# EasyEDA Pro project ProPrj_LoRa P_2026-10-21.epro

# Schematic Schematic1
Board Name: Board1; Create Date: 2026-07-01; Page Name: P1; Project Name: LoRa Puck; Schematic Name: Schematic1; Update Date: 2026-07-01; Company: EasyEDA.com; Page Size: A4; Version: V1.0
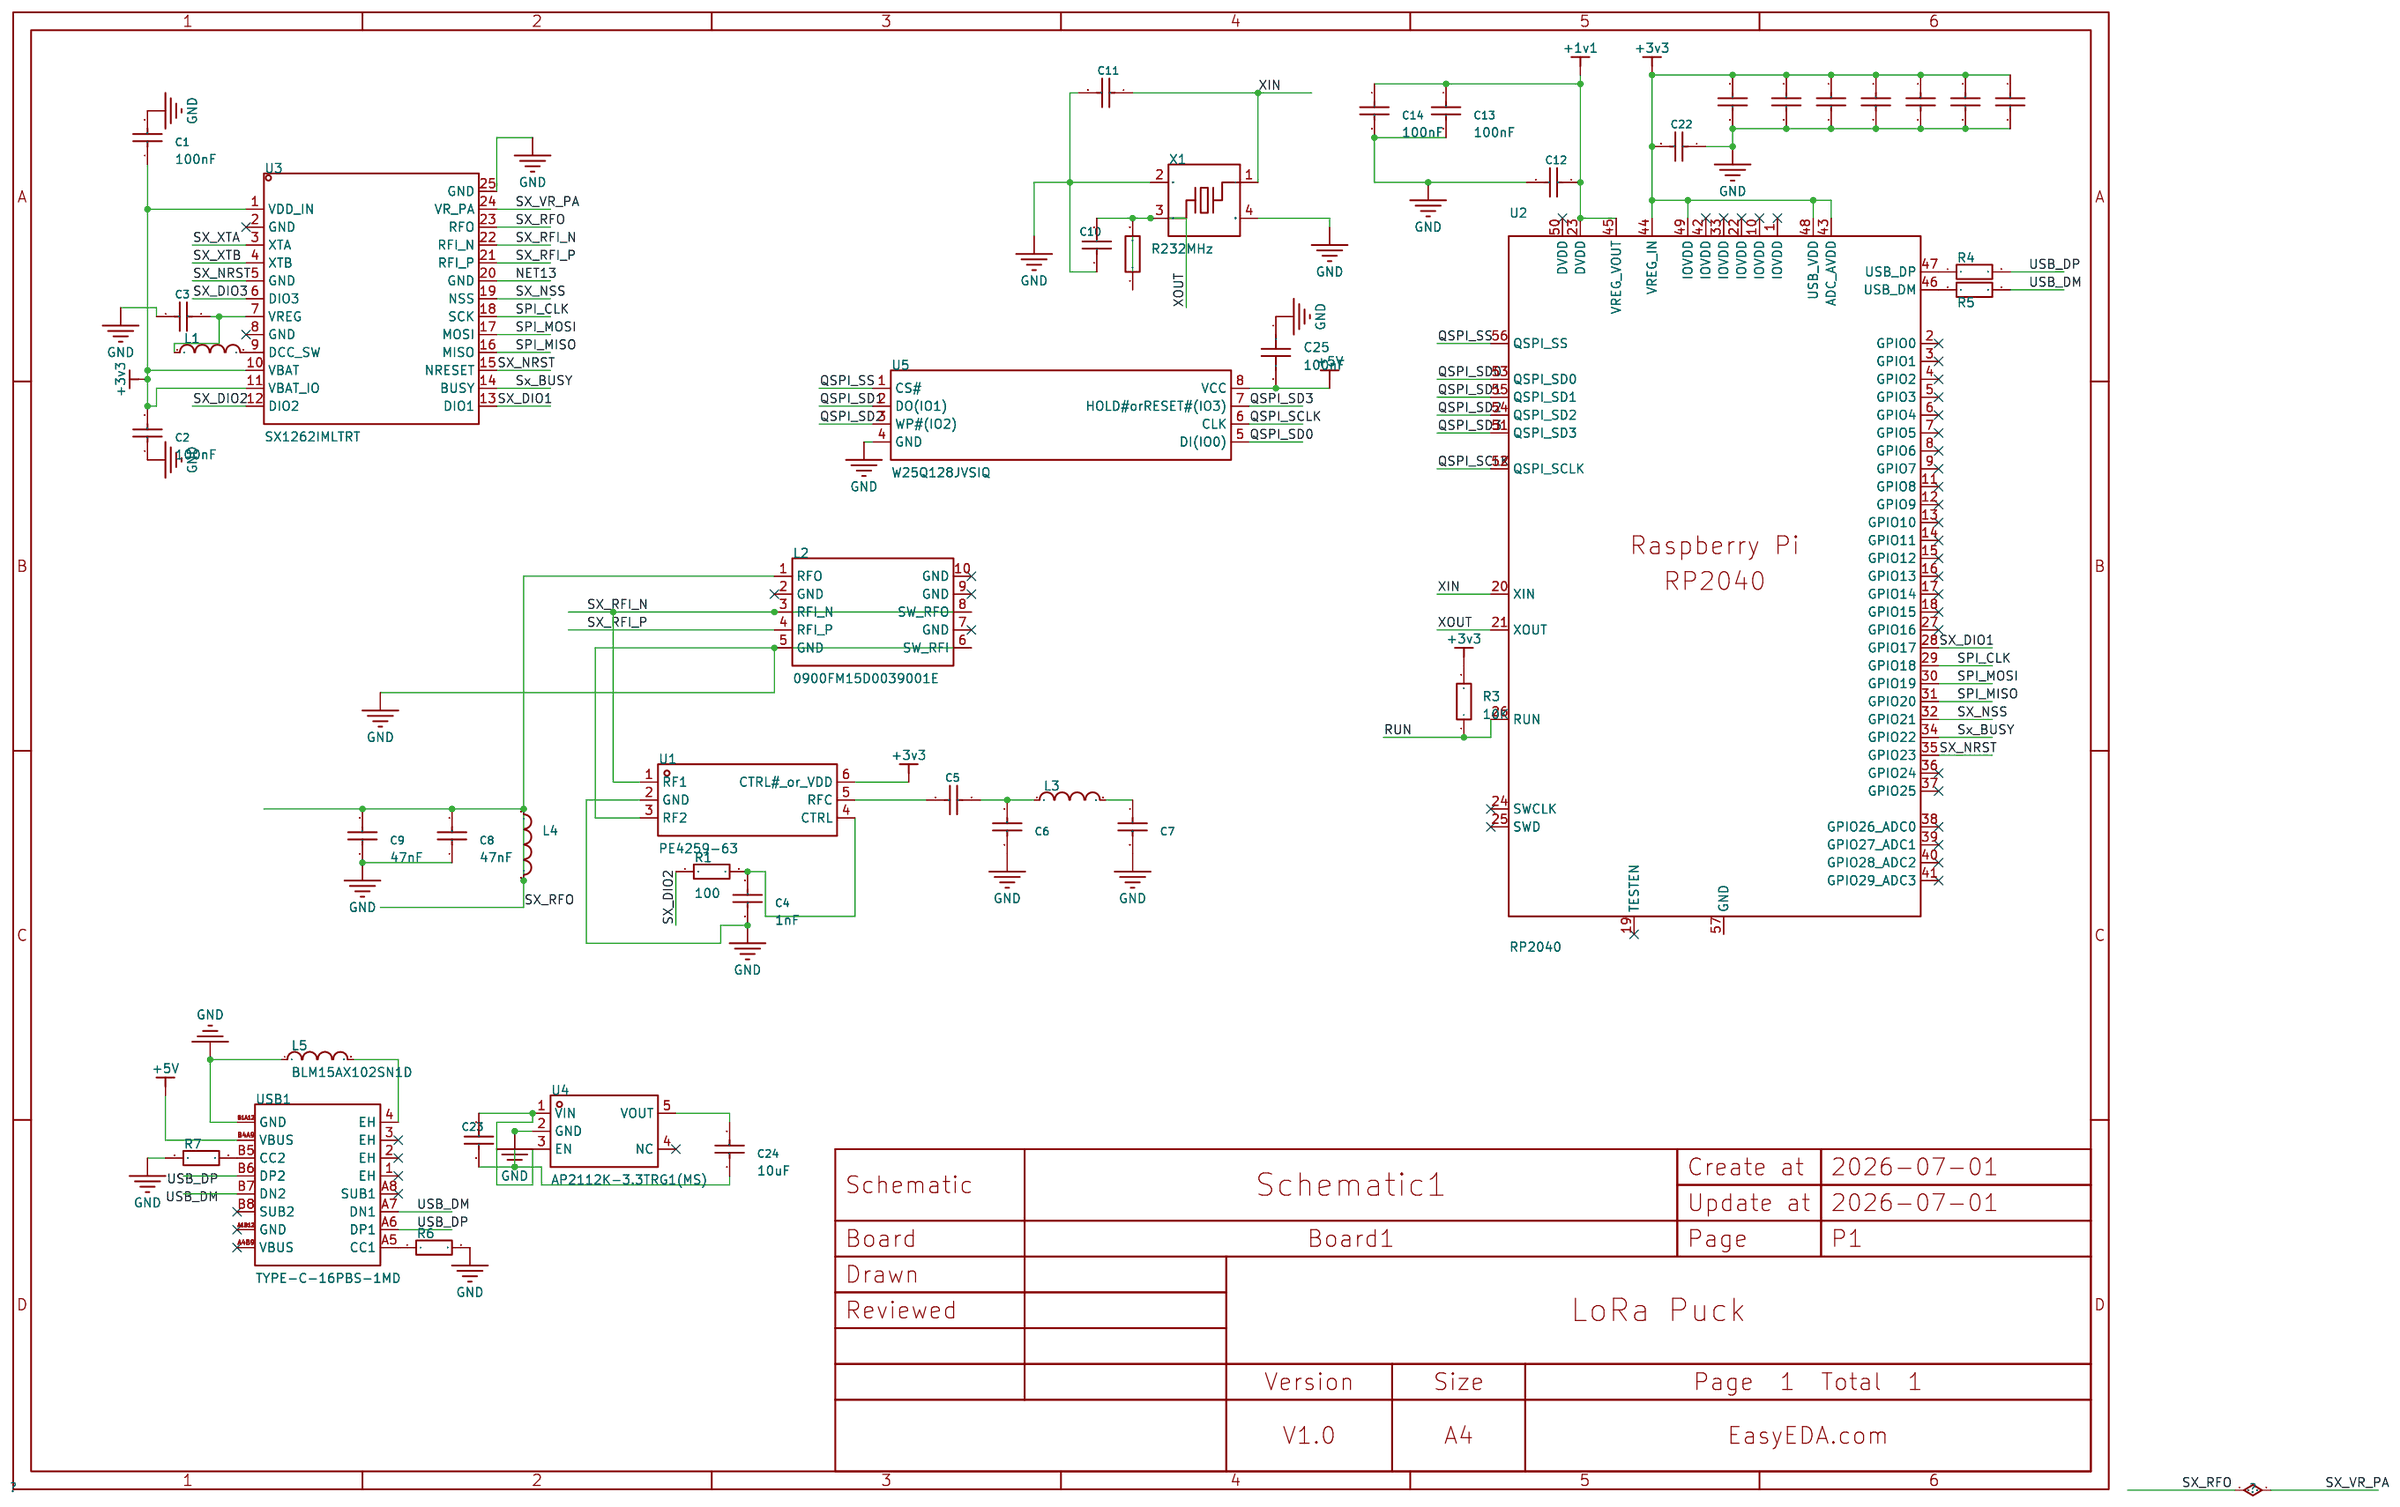
[diagram p0: schematic sheet]

## Parts
C1  100nF  [C0603]
C2  100nF  [C0603]
C3  470nF  [C0603]
C4  1nF  [C0603]
C5  39pF  [C0603]
C6  3.3pF  [C0603]
C7  3.3pF  [C0603]
C8  47nF  [C0603]
C9  47nF  [C0603]
C10  1nF  [C0603]
C11  1nF  [C0603]
C12  1uF  [C0603]
C13  100nF  [C0603]
C14  100nF  [C0603]
C15  100nF  [C0603]
C16  100nF  [C0603]
C17  100nF  [C0603]
C18  100nF  [C0603]
C19  100nF  [C0603]
C20  100nF  [C0603]
C21  100nF  [C0603]
C22  1uF  [C0603]
C23  10uF  [C0603]
C24  10uF  [C0603]
C25  100nF  [C0603]
L1  15uH  [L0603]
L2  0900FM15D0039001E  [FILTER-SMD_10P-L2.0-W1.3-BL]
L3  9.1nH  [L0603]
L4  47nH  [L0603]
L5  BLM15AX102SN1D  [L0402]
R1  100  [R0603]
R2  1K  [R0603]
R3  10K  [R0603]
R4  27.4  [R0603]
R5  22.7  [R0603]
R6  5.1K  [R0603]
R7  5.1K  [R0603]
U1  PE4259-63  [SC-70-6_L2.2-W1.3-P0.65-LS2.1-BL]
U2  RP2040  [QFN-56_L7.0-W7.0-P0.40-TL-EP4.0]
U3  SX1262IMLTRT  [QFN-24_L4.0-W4.0-P0.50-BL-EP2.6]
U4  AP2112K-3.3TRG1(MS)  [SOT-23-5_L2.9-W1.6-P0.95-LS2.7-BR]
U5  W25Q128JVSIQ  [SOIC-8_L5.3-W5.3-P1.27-LS8.0-BL]
USB1  TYPE-C-16PBS-1MD  [TYPE-C-SMD_TYPE-C-16PBS-1MD]
X1  32MHz  [CRYSTAL-SMD_4P-L3.2-W2.5-BL]

## Library data of the parts
C1-C24 = CC0603KRX7R8BB104: Capacitance: Tolerance:±10% Tolerance:±10% Voltage Rated: Temperature Coefficient:; LCSC Part Name: 100nF ±10% 25V; Supplier Part: C92490; Manufacturer: YAGEO(国巨); Supplier Footprint: 0603; JLCPCB Part Class: Extended Part; Datasheet: https://atta.szlcsc.com/upload/public/pdf/source/20170211/1486785656773.pdf; Supplier: LCSC; Tolerance: ±10%
C25 = CAP_0603: Supplier Footprint: 0603
L1 L3 L4 = L_0603
L2 = 0900FM15D0039001E: Frequency - Center:866MHz；915Hz Impedance:50Ω; Supplier Part: C17557877; Manufacturer: JOHANSON(约翰逊); Supplier Footprint: SMD-10P,2x1.2mm; JLCPCB Part Class: Extended Part; Datasheet: https://item.szlcsc.com/datasheet/0900FM15D0039001E/18687100.html; Supplier: LCSC; Frequency - Center: 866MHz；915Hz; Impedance: 50Ω
L5 = BLM15AX102SN1D: Impedance @ Frequency:1kΩ@100MHz Tolerance:±25% Tolerance:±25% DC Resistance(DCR):490mΩ Current Rating:350mA Number of Circuits:1 Operating Temperature:-55℃~+125℃ Operating Temperature:-55℃~+125℃; LCSC Part Name: 1 1kΩ@100MHz; Supplier Part: C85815; Manufacturer: muRata(村田); Supplier Footprint: 0402; JLCPCB Part Class: Extended Part; Datasheet: https://item.szlcsc.com/datasheet/BLM15AX102SN1D/86991.html; Supplier: LCSC; Impedance @ Frequency: 1kΩ@100MHz; Tolerance: ±25%; DC Resistance(DCR): 490mΩ; Current Rating: 350mA; Number of Circuits: 1; Operating Temperature: -55℃~+125℃
R1-R7 = Res_0603: Supplier Footprint: 0603
U1 = PE4259-63: Frequency range:- Frequency range:- isolation:30dB Insertion loss:0.35dB Voltage - Supply:1.8V~3.3V Voltage - Supply:1.8V~3.3V operating temperature:-40℃~+85℃ operating temperature:-40℃~+85℃; LCSC Part Name: 10MHz-3.0GHzSPDT高功率UltraCMOS射频开关; Supplier Part: C470892; Manufacturer: pSemi(游隼半导体); Supplier Footprint: SC-70-6; JLCPCB Part Class: Extended Part; Datasheet: https://item.szlcsc.com/datasheet/PE4259-63/477154.html; Supplier: LCSC; isolation: 30dB; Insertion loss: 0.35dB; Voltage - Supply: 1.8V~3.3V; operating temperature: -40℃~+85℃
U2 = RP2040: LCSC Part Name: 微控制器; Supplier Part: C2961140; Manufacturer: Raspberry Pi(树莓派); Supplier Footprint: QFN-56-EP(7x7); JLCPCB Part Class: Extended Part; Datasheet: https://item.szlcsc.com/datasheet/RP2040/3349129.html; Supplier: LCSC
U3 = SX1262IMLTRT: Frequency Range:- Frequency Range:- Interface:SPI Voltage - Supply:1.8V~3.7V Voltage - Supply:1.8V~3.7V Applications:General-purposeISM Output Power:22dBm Data Rate:300Kbps Current Of Transmitting:32mA Sensitivity:-148dBm Receive Current:4.2mA Operating T; Supplier Part: C191341; Manufacturer: SEMTECH; Supplier Footprint: QFN-24-EP(4x4); JLCPCB Part Class: Extended Part; Datasheet: https://item.szlcsc.com/datasheet/SX1262IMLTRT/216566.html; Supplier: LCSC; Interface: SPI; Voltage - Supply: 1.8V~3.7V; Applications: General-purposeISM; Output Power: 22dBm; Data Rate: 300Kbps; Current Of Transmitting: 32mA; Sensitivity: -148dBm; Receive Current: 4.2mA; Operating Temperature: -40℃~+85℃
U4 = AP2112K-3.3TRG1(MS): Output Configuration:Positive Voltage - Supply:6V Output Voltage:3.3V Output Voltage:3.3V Output Current:600mA Power Supply Rejection Ratio (PSRR):75dB@(1kHz) Voltage Dropout:320mV@(600mA) standby current:2uA Noise:- Features:Enable control；Short Circuit; LCSC Part Name: 3.3V 600mA 6V; Supplier Part: C22365427; Manufacturer: MSKSEMI(美森科); Supplier Footprint: SOT-23-5; JLCPCB Part Class: Extended Part; Datasheet: https://item.szlcsc.com/datasheet/AP2112K-3.3TRG1(MS)/23832169.html; Supplier: LCSC; Output Configuration: Positive; Voltage - Supply: 6V; Output Voltage: 3.3V; Output Current: 600mA; Power Supply Rejection Ratio (PSRR): 75dB@(1kHz); Voltage Dropout: 320mV@(600mA); standby current: 2uA; Features: Enable control；Short Circuit Protection；Over Current Protection；Thermal shutdown; Operating Temperature: -40℃~+125℃@(Tj); Output Type: Fixed; Number of Outputs: 1
U5 = W25Q128JVSIQ_C113767: Interface:SPI Memory Size:- Clock Frequency:133MHz Voltage - Supply:2.7V~3.6V Voltage - Supply:2.7V~3.6V Program / Erase Cycles:100,000 Cycles Page Programming Time (Tpp):3ms Operating Temperature:- Operating Temperature:-; LCSC Part Name: 支持双路/四路SPI接口的3V、128Mbit 串行闪存; Supplier Part: C113767; Manufacturer: Winbond(华邦); Supplier Footprint: SOIC-8-208mil; JLCPCB Part Class: Extended Part; Datasheet: https://item.szlcsc.com/datasheet/W25Q128JVSIQ/115003.html; Supplier: LCSC; Interface: SPI; Clock Frequency: 133MHz; Voltage - Supply: 2.7V~3.6V; Program / Erase Cycles: 100,000 Cycles; Page Programming Time (Tpp): 3ms
USB1 = TYPE-C-16PBS-1MD: Connector Type:Type-C Gender:Female Mounting Type:Surface Mount, Right Angle Number of Ports:1 Current Rating-Power:3A Voltage Rating:5V Connect-Disconnect Life:5000 cycles Length:7.35mm Operating Temperature:-25℃~+85℃ Operating Temperature:-25℃~+85℃; LCSC Part Name: Type-C 母 卧贴; Supplier Part: C51927421; Manufacturer: CAX(创都); Supplier Footprint: SMD; JLCPCB Part Class: Extended Part; Datasheet: https://item.szlcsc.com/datasheet/TYPE-C-16PBS-1MD/54633782.html; Supplier: LCSC; Connector Type: Type-C; Gender: Female; Mounting Type: Surface Mount, Right Angle; Number of Ports: 1; Current Rating-Power: 3A; Voltage Rating: 5V; Connect-Disconnect Life: 5000 cycles; Length: 7.35mm; Operating Temperature: -25℃~+85℃
X1 = NX3225SA-32.000M-STD-CSR-1: Frequency:32MHz Normal temperature Frequency Tolerance:±15ppm Normal temperature Frequency Tolerance:±15ppm Load Capacitance:8pF Frequency Stability:±15ppm Frequency Stability:±15ppm Equivalent Series Resistance(ESR):50Ω Operating Temperature:-10℃~+75℃ Op; LCSC Part Name: 32MHz ±15ppm 8pF; Supplier Part: C1985986; Manufacturer: NDK; Supplier Footprint: SMD3225-4P; JLCPCB Part Class: Extended Part; Datasheet: https://item.szlcsc.com/datasheet/NX3225SA-32.000M-STD-CSR-1/2077530.html; Supplier: LCSC; Normal temperature Frequency Tolerance: ±15ppm; Load Capacitance: 8pF; Frequency Stability: ±15ppm; Equivalent Series Resistance(ESR): 50Ω; Operating Temperature: -10℃~+75℃

## Nets
+1v1: C12.1 C13.1 C14.1 U2.23(DVDD) U2.45(VREG_VOUT)
+3v3: C1.1 C2.2 C15.1 C16.1 C17.1 C18.1 C19.1 C20.1 C21.1 C22.2 R3.2 U1.6(CTRL# or VDD) U2.43(ADC_AVDD) U2.44(VREG_IN) U2.48(USB_VDD) U2.49(IOVDD) U3.1(VDD_IN) U3.10(VBAT) U3.11(VBAT_IO)
+5V: C25.2 U5.8(VCC) USB1.B4A9(VBUS)
GND: C1.2 C2.1 C3.2 C4.1 C6.2 C7.2 C8.1 C9.1 C10.1 C11.2 C12.2 C13.2 C14.2 C15.2 C16.2 C17.2 C18.2 C19.2 C20.2 C21.2 C22.1 C23.1 C24.1 C25.1 L2.5(GND) L2.6(SW_RFI) L5.1 R6.2 R7.1 U1.2(GND) U1.3(RF2) U3.25(GND) U4.2(GND) U5.4(GND) USB1.B1A12(GND) X1.2(GND) X1.4(GND)
NET13: U3.20(GND)
QSPI_SCLK: U2.52(QSPI_SCLK) U5.6(CLK)
QSPI_SD0: U2.53(QSPI_SD0) U5.5(DI(IO0))
QSPI_SD1: U2.55(QSPI_SD1) U5.2(DO(IO1))
QSPI_SD2: U2.54(QSPI_SD2) U5.3(WP#(IO2))
QSPI_SD3: U2.51(QSPI_SD3) U5.7(HOLD#orRESET#(IO3))
QSPI_SS: U2.56(QSPI_SS) U5.1(CS#)
RUN: R3.1 U2.26(RUN)
SPI_CLK: U2.29(GPIO18) U3.18(SCK)
SPI_MISO: U2.31(GPIO20) U3.16(MISO)
SPI_MOSI: U2.30(GPIO19) U3.17(MOSI)
Sx_BUSY: U2.34(GPIO22) U3.14(BUSY)
SX_DIO1: U2.28(GPIO17) U3.13(DIO1)
SX_DIO2: R1.1 U3.12(DIO2)
SX_DIO3: U3.6(DIO3)
SX_NRST: U2.35(GPIO23) U3.5(GND) U3.15(NRESET)
SX_NSS: U2.32(GPIO21) U3.19(NSS)
SX_RFI_N: L2.3(RFI_N) L2.8(SW_RFO) U1.1(RF1) U3.22(RFI_N)
SX_RFI_P: L2.4(RFI_P) U3.21(RFI_P)
SX_RFO: C8.2 C9.2 L2.1(RFO) L4.1 L4.2 U3.23(RFO) U3.24(VR_PA)
SX_XTA: U3.3(XTA)
SX_XTB: U3.4(XTB)
USB_DM: R5.2 USB1.A7(DN1) USB1.B7(DN2)
USB_DP: R4.2 USB1.A6(DP1) USB1.B6(DP2)
XIN: C11.1 U2.20(XIN) X1.1
XOUT: C10.2 R2.1 R2.2 U2.21(XOUT) X1.3
$1N27: L1.2 U3.9(DCC_SW)
$1N28: C3.1 L1.1 U3.7(VREG)
$1N54: C4.2 R1.2 U1.4(CTRL)
$1N61: C5.2 U1.5(RFC)
$1N69: C5.1 C6.1 L3.1
$1N70: C7.1 L3.2
$1N85: R4.1 U2.47(USB_DP)
$1N86: R5.1 U2.46(USB_DM)
$1N98: C23.2 U4.1(VIN) U4.3(EN)
$1N100: C24.2 U4.5(VOUT)
$1N103: L5.2 USB1.4(EH)
$1N111: R6.1 USB1.A5(CC1)
$1N112: R7.2 USB1.B5(CC2)

Not connected (* = marked no-connect by the designer): L2 2(GND)* 7(GND)* 9(GND)* 10(GND)*; U2 1(IOVDD)* 2(GPIO0)* 3(GPIO1)* 4(GPIO2)* 5(GPIO3)* 6(GPIO4)* 7(GPIO5)* 8(GPIO6)* 9(GPIO7)* 10(IOVDD)* 11(GPIO8)* 12(GPIO9)* 13(GPIO10)* 14(GPIO11)* 15(GPIO12)* 16(GPIO13)* 17(GPIO14)* 18(GPIO15)* 19(TESTEN)* 22(IOVDD)* 24(SWCLK)* 25(SWD)* 27(GPIO16)* 33(IOVDD)* 36(GPIO24)* 37(GPIO25)* 38(GPIO26_ADC0)* 39(GPIO27_ADC1)* 40(GPIO28_ADC2)* 41(GPIO29_ADC3)* 42(IOVDD)* 50(DVDD)* 57(GND); U3 2(GND)* 8(GND)*; U4 4(NC)*; USB1 1(EH)* 2(EH)* 3(EH)* A1B12(GND)* A4B9(VBUS)* A8(SUB1)* B8(SUB2)*

# Board PCB1
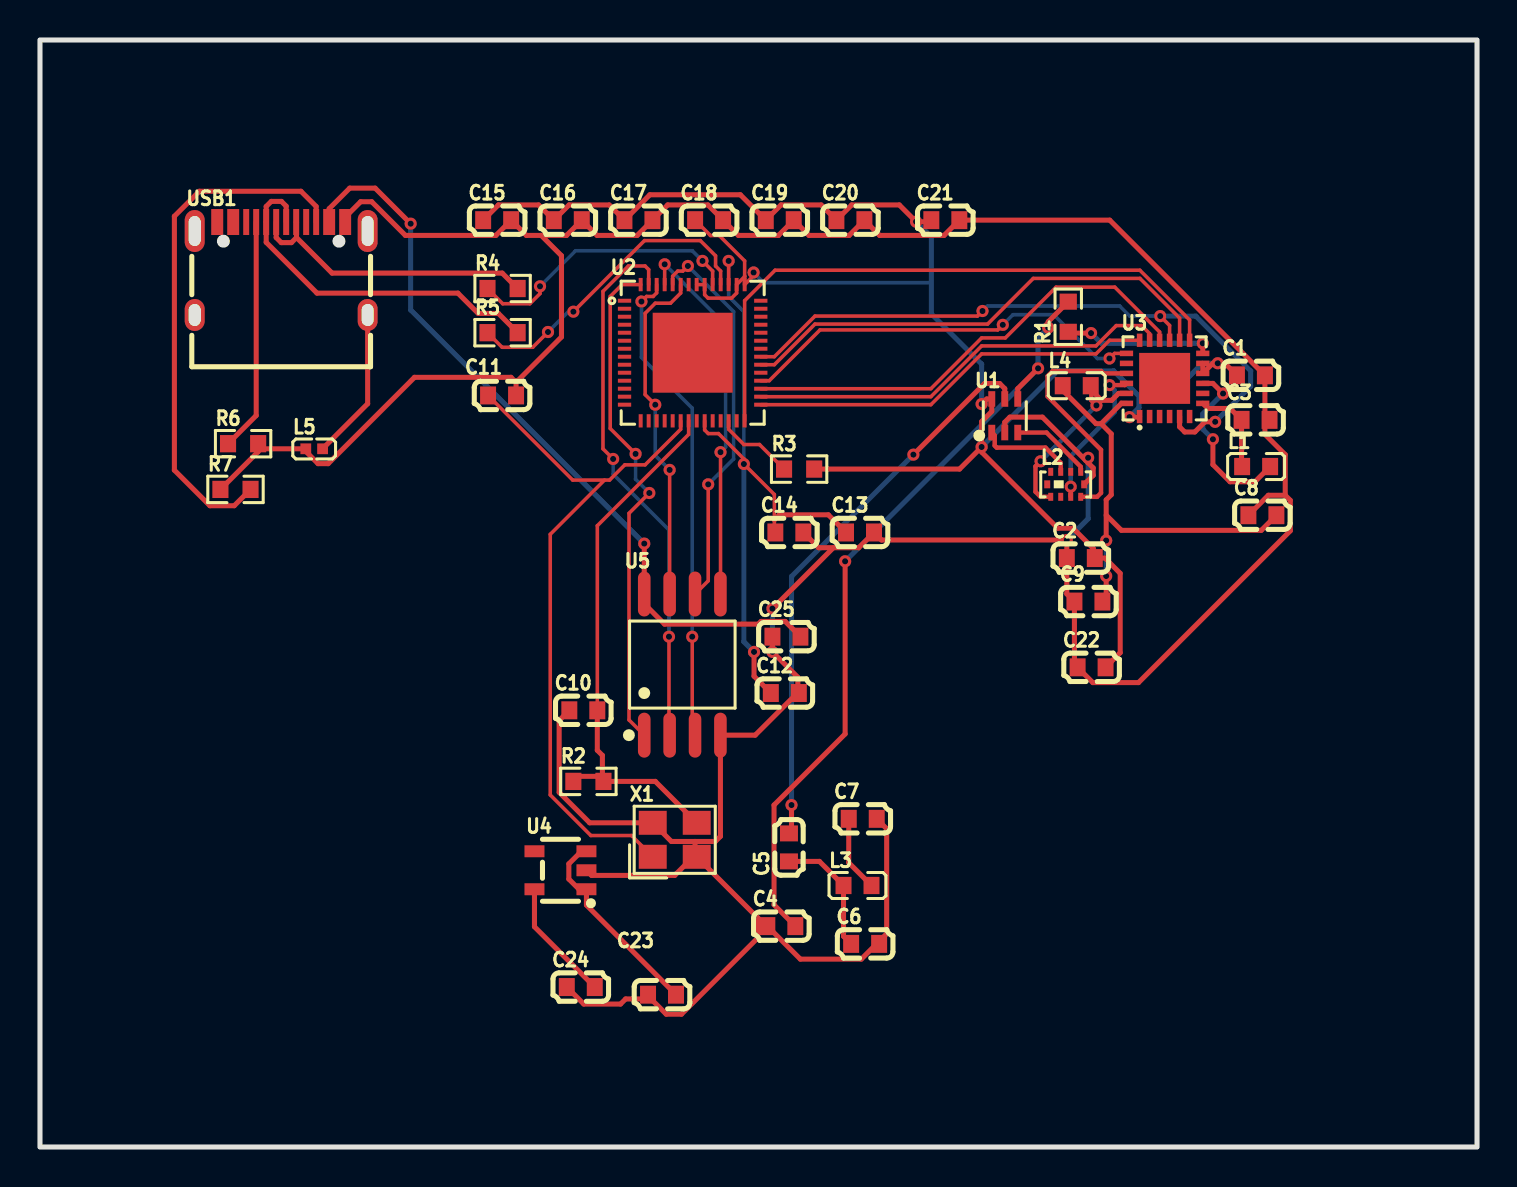
[diagram p1: board, top side]
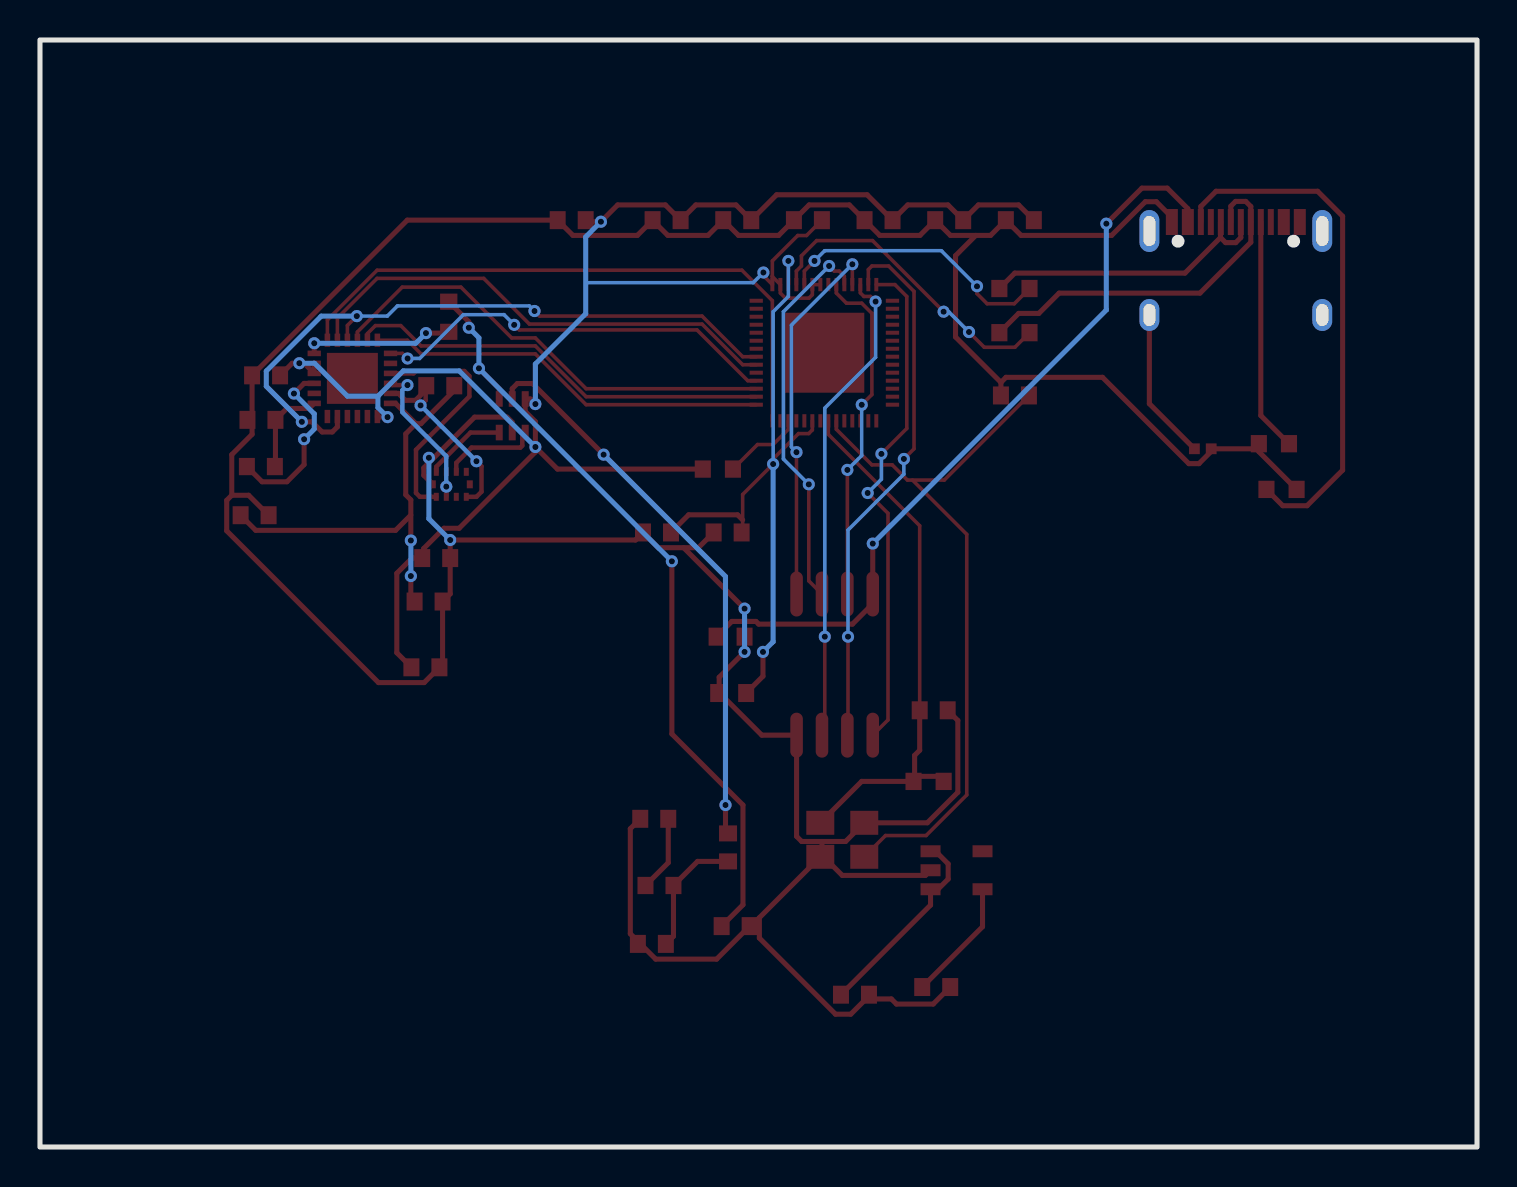
[diagram p2: board, bottom side, seen from below]

Outline 71.88 x 55.37 mm; copper layers: Top Layer, Bottom Layer. Coordinates in mm from the lower left corner of the outline.
Outline path: rectangle 0,55.37 71.88,0
Stack: Top Layer 0.035mm / Dielectric1 1.51mm FR4 er 4.5 / Bottom Layer 0.035mm

## Design rules (mm)
spacing copperThickness1oz (default): track to track 0.102, other pairs 0.152 to 0.3
spacing copperThickness2oz: track to track 0.203, other pairs 0.152 to 0.3
track width copperThickness1oz (default): min 0.127, default 0.254, max 2.54
track width copperThickness2oz: min 0.203, default 0.254, max 2.54
differential pair differentialPair (default): width min 0.127, default 0.254, max 2.54; gap min 0.152, default 0.152

## Placement (name value [footprint] x y rotation side)
C1  100nF  [C0603]  60.57 38.6 0 top
C2  100nF  [C0603]  52.06 29.46 0 top
C3  470nF  [C0603]  60.8 36.37 0 top
C4  1nF  [C0603]  37.08 11.05 0 top
C5  39pF  [C0603]  37.47 14.99 90 top
C6  3.3pF  [C0603]  41.28 10.16 0 top
C7  3.3pF  [C0603]  41.16 16.42 0 top
C8  47nF  [C0603]  61.15 31.6 0 top
C9  47nF  [C0603]  52.44 27.28 0 top
C10  1nF  [C0603]  27.18 21.84 0 top
C11  1nF  [C0603]  23.11 37.59 0 top
C12  1uF  [C0603]  37.26 22.71 0 top
C13  100nF  [C0603]  41.02 30.74 0 top
C14  100nF  [C0603]  37.48 30.74 0 top
C15  100nF  [C0603]  22.87 46.36 0 top
C16  100nF  [C0603]  26.4 46.36 0 top
C17  100nF  [C0603]  29.94 46.36 0 top
C18  100nF  [C0603]  33.47 46.36 0 top
C19  100nF  [C0603]  37 46.36 0 top
C20  100nF  [C0603]  40.54 46.36 0 top
C21  100nF  [C0603]  45.29 46.36 0 top
C22  1uF  [C0603]  52.6 23.99 0 top
C23  10uF  [C0603]  31.12 7.62 0 top
C24  10uF  [C0603]  27.05 8 0 top
C25  100nF  [C0603]  37.34 25.53 0 top
L1  15uH  [L0603]  60.83 34.04 0 top
L2  0900FM15D0039001E  [FILTER-SMD_10P-L2.0-W1.3-BL]  51.31 33.15 0 top
L3  9.1nH  [L0603]  40.89 13.08 0 top
L4  47nH  [L0603]  51.86 38.08 0 top
L5  BLM15AX102SN1D  [L0402]  13.72 34.92 0 top
R1  100  [R0603]  51.44 41.53 90 top
R2  1K  [R0603]  27.43 18.29 0 top
R3  10K  [R0603]  37.97 33.91 0 top
R4  27.4  [R0603]  23.14 42.94 0 top
R5  22.7  [R0603]  23.14 40.73 0 top
R6  5.1K  [R0603]  10.16 35.18 0 top
R7  5.1K  [R0603]  9.78 32.89 0 top
U1  PE4259-63  [SC-70-6_L2.2-W1.3-P0.65-LS2.1-BL]  48.26 36.58 0 top
U2  RP2040  [QFN-56_L7.0-W7.0-P0.40-TL-EP4.0]  32.65 39.73 0 top
U3  SX1262IMLTRT  [QFN-24_L4.0-W4.0-P0.50-BL-EP2.6]  56.26 38.45 0 top
U4  AP2112K-3.3TRG1(MS)  [SOT-23-5_L2.9-W1.6-P0.95-LS2.7-BR]  26.03 13.84 0 top
U5  W25Q128JVSIQ  [SOIC-8_L5.3-W5.3-P1.27-LS8.0-BL]  32.13 24.13 0 top
USB1  TYPE-C-16PBS-1MD  [TYPE-C-SMD_TYPE-C-16PBS-1MD]  12.06 43.94 0 top
X1  32MHz  [CRYSTAL-SMD_4P-L3.2-W2.5-BL]  31.75 15.37 0 top

## Footprints (pads in the part's own frame, mm; a bottom-side part is the same pattern mirrored in y, then rotated)
C0603
  rect 0.8x0.9 smd: 1(-0.7,0) 2(0.7,0)
CRYSTAL-SMD_4P-L3.2-W2.5-BL
  rect 1.4x1.2 smd: 1(-1.1,-0.85) 2(1.1,-0.85) 3(1.1,0.85) 4(-1.1,0.85)
FILTER-SMD_10P-L2.0-W1.3-BL
  rect 0.25x0.4 smd: 1(-0.75,-0.625) 2(-0.25,-0.625) 3(0.25,-0.625) 4(0.75,-0.625) 6(0.75,0.625) 7(0.25,0.625) 8(-0.25,0.625) 9(-0.75,0.625)
  rect 0.3x0.4 smd: 5(0.925,0) 10(-0.925,0)
L0402
  rect 0.54x0.54 smd: 1(-0.42,0) 2(0.42,0)
L0603
  rect 0.8x0.864 smd: 1(-0.7,0) 2(0.7,0)
QFN-24_L4.0-W4.0-P0.50-BL-EP2.6
  rect 0.28x0.665 smd: 1(-1.25,-1.907) 2(-0.75,-1.907) 3(-0.25,-1.907) 4(0.25,-1.907) 5(0.75,-1.907) 6(1.25,-1.907) 13(1.25,1.907) 14(0.75,1.907) 15(0.25,1.907) 16(-0.25,1.907) 17(-0.75,1.907) 18(-1.25,1.907)
  rect 0.665x0.28 smd: 7(1.907,-1.25) 8(1.907,-0.75) 9(1.907,-0.25) 10(1.907,0.25) 11(1.907,0.75) 12(1.907,1.25) 19(-1.907,1.25) 20(-1.907,0.75) 21(-1.907,0.25) 22(-1.907,-0.25) 23(-1.907,-0.75) 24(-1.907,-1.25)
  rect 2.55x2.55 smd: 25(0,0)
QFN-56_L7.0-W7.0-P0.40-TL-EP4.0
  rect 0.665x0.2 smd: 1(-3.408,2.6) 2(-3.408,2.2) 3(-3.408,1.8) 4(-3.408,1.4) 5(-3.408,1) 6(-3.408,0.6) 7(-3.408,0.2) 8(-3.408,-0.2) 9(-3.408,-0.6) 10(-3.408,-1) 11(-3.408,-1.4) 12(-3.408,-1.8) 13(-3.408,-2.2) 14(-3.408,-2.6) 29(3.408,-2.6) 30(3.408,-2.2) 31(3.408,-1.8) 32(3.408,-1.4) 33(3.408,-1) 34(3.408,-0.6) 35(3.408,-0.2) 36(3.408,0.2) 37(3.408,0.6) 38(3.408,1) 39(3.408,1.4) 40(3.408,1.8) 41(3.408,2.2) 42(3.408,2.6)
  rect 0.2x0.665 smd: 15(-2.6,-3.408) 16(-2.2,-3.408) 17(-1.8,-3.408) 18(-1.4,-3.408) 19(-1,-3.408) 20(-0.6,-3.408) 21(-0.2,-3.408) 22(0.2,-3.408) 23(0.6,-3.408) 24(1,-3.408) 25(1.4,-3.408) 26(1.8,-3.408) 27(2.2,-3.408) 28(2.6,-3.408) 43(2.6,3.408) 44(2.2,3.408) 45(1.8,3.408) 46(1.4,3.408) 47(1,3.408) 48(0.6,3.408) 49(0.2,3.408) 50(-0.2,3.408) 51(-0.6,3.408) 52(-1,3.408) 53(-1.4,3.408) 54(-1.8,3.408) 55(-2.2,3.408) 56(-2.6,3.408)
  rect 4x4 smd: 57(0,0)
R0603
  rect 0.806x0.864 smd: 1(-0.753,0) 2(0.753,0)
SC-70-6_L2.2-W1.3-P0.65-LS2.1-BL
  rect 0.35x0.78 smd: 1(-0.65,-0.84) 2(0,-0.84) 3(0.65,-0.84) 4(0.65,0.84) 5(0,0.84) 6(-0.65,0.84)
SOIC-8_L5.3-W5.3-P1.27-LS8.0-BL
  oval 0.63x2.25 smd: 1(-1.905,-3.53) 2(-0.635,-3.53) 3(0.635,-3.53) 4(1.905,-3.53) 5(1.905,3.53) 6(0.635,3.53) 7(-0.635,3.53) 8(-1.905,3.53)
SOT-23-5_L2.9-W1.6-P0.95-LS2.7-BR
  rect 1x0.6 smd: 1(1.3,-0.95) 2(1.3,0) 3(1.3,0.95) 4(-1.3,0.95) 5(-1.3,-0.95)
TYPE-C-SMD_TYPE-C-16PBS-1MD
  oval 1x2.1 hole 0.6x1.5: 1(-4.325,1.875) 2(4.325,1.875)
  oval 1x1.6 hole 0.6x1.1: 3(-4.325,-2.325) 4(4.325,-2.325)
  rect 0.6x1.3 smd: A1B12(-3.2,2.325) A4B9(-2.4,2.325) B1A12(3.2,2.325) B4A9(2.4,2.325)
  rect 0.3x1.3 smd: A5(-1.25,2.325) A6(-0.25,2.325) A7(0.25,2.325) A8(1.25,2.325) B5(1.75,2.325) B6(0.75,2.325) B7(-0.75,2.325) B8(-1.75,2.325)

## Nets
As in the schematic, except:
GND: C1.2 C2.1 C3.2 C4.1 C6.2 C7.2 C8.1 C9.1 C10.1 C11.2 C12.2 C13.2 C14.2 C15.2 C16.2 C17.2 C18.2 C19.2 C20.2 C21.2 C22.1 C23.1 C24.1 C25.1 L2.5 L5.1 R6.2 R7.1 U1.2 U3.25 U4.2 U5.4 USB1.B1A12 X1.2 X1.4
SX_RFI_N: L2.3 U3.22
SX_RFO: L2.1 L4.2 U3.23
SX_VR_PA: C8.2 C9.2 L4.1 U3.24
$1N58: L2.8 U1.1
$1N59: L2.6 U1.3

Pads without a net: L2 2 7 9 10; U2 1 2 3 4 5 6 7 8 9 10 11 12 13 14 15 16 17 18 19 22 24 25 27 33 36 37 38 39 40 41 42 50 57; U3 2 8; U4 4; USB1 1 2 3 A1B12 A4B9 A8 B8

## Via types
v1: diameter 0.61, hole 0.305, Top Layer to Bottom Layer, 51 vias

## Routing (per net, layer and track width the routed paths; a pad name or vN(x,y) marks a point on that pad's centre or on a via; arc(x,y) is an arc through that point)
+1V1: length 35.1
  Top Layer w0.18: 34.45,43.14 v1(34.45,44.32) ; 33.25,36.32 33.25,35.87 33.43,35.69 33.94,35.69 35.21,34.42 v1(35.21,34.16) 36.73,32.64 36.73,30.79 36.78,30.74
  Top Layer w0.254: v1(35.72,24.76) 35.72,23.55 36.56,22.71 ; 36.73,31.37 36.99,31.62 39.44,31.62 40.32,30.74
  Bottom Layer w0.18: v1(34.45,44.32) 34.45,42.54 35.21,41.78 v1(35.21,34.16)
  Bottom Layer w0.254: v1(35.72,24.76) 35.21,25.27 v1(35.21,34.16)
+3V3: length 100.7
  Top Layer w0.18: 32.85,43.14 33.25,43.14 33.25,42.63 33.42,42.46 34.59,42.46 34.85,42.71 34.85,43.14 35.25,43.54 35.25,43.56 ; 35.25,43.56 35.25,43.14 35.7,43.59 v1(35.7,43.74) ; 35.25,43.56 35.25,44.32 33.98,45.59 33.54,45.59 32.77,46.36
  Top Layer w0.252: 52.76,29.46 52.69,29.53 52.69,29.93 51.67,30.95 50.91,30.95 47.1,34.76 v1(47.1,35.01) 47.1,36.28 47.61,36.79 47.61,37.42 ; 59.87,38.6 59.27,39.2 v1(58.91,39.2) 58.67,39.2 58.16,38.69 58.16,39.2 ; v1(54.5,36.51) 54.98,36.51 55.01,36.54
  Top Layer w0.254: v1(47.1,35.01) 46,33.91 38.73,33.91 ; 52.76,29.46 53.27,29.46 54.03,28.7 54.03,24.72 53.3,23.99 ; 44.59,46.36 44.51,46.28 v1(43.82,46.28) 42.98,47.12 40.6,47.12 39.84,46.36 39.08,47.12 37.07,47.12 36.3,46.36 35.03,47.63 30.51,47.63 29.24,46.36 28.47,47.12 26.46,47.12 25.7,46.36 24.94,47.12 22.93,47.12 22.17,46.36 ; v1(47.1,37.16) 47.36,37.42 47.61,37.42
  Bottom Layer w0.18: 44.59,43.23 36.2,43.23 v1(35.7,43.74)
  Bottom Layer w0.252: 54.98,37.55 56.5,37.55 58.15,39.2 v1(58.91,39.2) ; 54.98,37.55 54.98,36.99 v1(54.5,36.51) ; 54.98,37.55 53.71,38.82 50.91,38.82 v1(47.1,35.01)
  Bottom Layer w0.254: v1(47.1,37.16) 47.1,39.16 44.59,41.68 44.59,45.52 v1(43.82,46.28)
+5V: length 38.4
  Top Layer w0.254: v1(30.23,30.18) U5.8 30.23,27.17 31.24,26.15 35.93,26.15 36.07,26.29 37.28,26.29 38.04,25.53 ; USB1.B4A9 14.47,46.93 15.49,47.96 16.76,47.96 v1(18.54,46.18)
  Bottom Layer w0.254: v1(30.23,30.18) 18.54,41.87 v1(18.54,46.18)
GND: length 211
  Top Layer w0.254: C10.1 25.97,21.34 25.97,17.74 27.49,16.22 X1.4 31.58,15.28 33.78,15.28 34.04,15.54 U5.4 35.78,20.6 37.91,22.73 ; R7.1 10.91,34.78 R6.2 11.17,34.92 13.3,34.92 13.3,34.79 13.91,34.18 14.42,34.18 18.73,38.5 23.56,38.5 23.81,38.25 ; 23.81,38.25 C11.2 ; 23.81,38.25 26.09,40.52 26.09,44.58 25.07,45.6 ; 30.31,7.41 C23.1 ; 32.77,15.28 32.77,14.6 ; 32.77,14.6 X1.2 36.32,11.05 C4.1 38.03,9.4 41.08,9.4 41.84,10.16 ; 32.77,14.6 31.75,13.58 27.59,13.58 U4.2 ; 37.91,22.73 37.91,23.5 v1(36.64,24.77) C25.1 ; 37.91,22.73 C12.2 ; 41.84,10.16 C6.2 ; 41.84,10.16 42.35,10.67 42.35,15.92 C7.2 ; 62.29,32.6 62.29,34.63 61.27,35.65 61.27,38.6 53.51,46.36 C21.2 45.22,45.6 42,45.6 C20.2 40.48,45.6 38.47,45.6 C19.2 36.94,45.6 34.93,45.6 C18.2 33.41,47.12 31.4,47.12 C17.2 29.87,45.6 27.86,45.6 27.1,46.36 26.34,45.6 24.33,45.6 C15.2 22.81,45.6 18.28,45.6 16.59,47.28 16.04,47.28 15.26,46.51 USB1.B1A12 ; 62.29,32.6 62.54,32.35 62.54,30.82 54.95,23.23 52.66,23.23 C22.1 51.74,24.15 C9.1 51.36,27.66 C2.1 v1(51.36,30.36) 42.1,30.36 C13.2 40.96,29.98 38.95,29.98 C14.2 ; 62.29,32.6 61.44,32.6 C8.1 ; 35.9,11.47 35.9,10.45 32.09,6.64 31.33,6.64 30.56,7.41 29.29,7.41 29.04,7.15 27.2,7.15 C24.1 ; L2.5 52.68,33.6 52.68,33.97 50.14,36.51 48.51,36.51 48.26,36.25 U1.2 ; 39.69,29.98 v1(36.64,26.93) ; 52.43,34.22 v1(52.43,34.47) ; C3.2 61.47,36.41 61.27,36.41
  Bottom Layer w0.254: v1(52.43,34.47) 52.43,31.43 v1(51.36,30.36) ; v1(36.64,26.93) v1(36.64,24.77)
QSPI_SCLK: length 19.5
  Top Layer w0.18: v1(33.43,33.15) 33.43,28.32 U5.6 ; v1(32.41,44.07) 32.16,43.81 31.9,43.81 31.65,43.56 U2.52
  Bottom Layer w0.18: v1(32.41,44.07) 34.7,41.78 34.7,34.42 v1(33.43,33.15)
QSPI_SD0: length 18.9
  Top Layer w0.18: v1(34.04,34.75) 34.04,27.67 ; U2.53 v1(31.25,44.15)
  Bottom Layer w0.18: v1(34.04,34.75) 34.3,35.01 34.3,41.1 v1(31.25,44.15)
QSPI_SD1: length 27.2
  Top Layer w0.18: v1(28.67,34.42) 28.16,34.92 28.16,42.8 29.43,44.07 30.27,44.07 30.45,43.89 U2.55 ; U5.2 31.46,20.63 v1(31.46,25.53)
  Bottom Layer w0.18: v1(31.46,25.53) 31.46,30.86 28.67,33.65 v1(28.67,34.42)
QSPI_SD2: length 24.2
  Top Layer w0.18: U5.3 32.63,20.74 v1(32.63,25.53) ; U2.54 30.85,42.72 30.67,42.54 30.34,42.54 v1(30.09,42.29)
  Bottom Layer w0.18: v1(32.63,25.53) 32.63,36.96 30.09,39.5 v1(30.09,42.29)
QSPI_SD3: length 17.2
  Top Layer w0.18: v1(31.5,33.87) U5.7 ; U2.51 32.05,42.71 31.54,42.21 30.78,42.21 30.27,41.7 30.27,37.63 v1(30.78,37.13)
  Bottom Layer w0.18: v1(30.78,37.13) 30.78,34.59 v1(31.5,33.87)
QSPI_SS: length 25.3
  Top Layer w0.18: U5.1 29.46,21.36 29.46,31.7 v1(30.48,32.71) ; U2.56 29.12,43.14 28.52,42.54 28.52,35.94 v1(29.79,34.67)
  Bottom Layer w0.18: v1(29.79,34.67) 29.79,33.4 v1(30.48,32.71)
RUN: length 4
  Top Layer w0.18: U2.26 34.45,35.9 35.21,35.14 35.99,35.14 R3.1
SPI_CLK: length 20.3
  Top Layer w0.18: U3.18 53.5,40.35 52.82,39.67 47.1,39.67 44.56,37.13 U2.29
SPI_MISO: length 23.4
  Top Layer w0.18: U2.31 44.56,37.93 47.1,40.47 48.29,40.47 50.83,43.01 53.76,43.01 56.01,40.77 U3.16
SPI_MOSI: length 21.4
  Top Layer w0.18: U2.30 44.56,37.53 47.1,40.07 52.82,40.07 53.84,41.09 55.1,41.09 55.51,40.69 U3.17
SX_BUSY: length 24.7
  Top Layer w0.18: 36.06,39.13 36.73,39.13 38.76,41.16 47.4,41.16 49.69,43.45 55.02,43.45 57.01,41.46 57.01,40.35
SX_DIO1: length 30.9
  Top Layer w0.18: U3.13 57.51,41.37 55.02,43.86 36.77,43.86 35.25,42.33 U2.28
SX_DIO2: length 7.5
  Top Layer w0.252: v1(52.57,40.71) 51.5,40.71 R1.1 ; U3.12 v1(58.16,40.2)
  Bottom Layer w0.252: v1(58.16,40.2) 53.08,40.2 v1(52.57,40.71)
SX_NRST: length 34.2
  Top Layer w0.18: v1(47.15,41.82) 46.89,41.56 38.76,41.56 36.73,39.53 U2.35 ; U3.15 56.51,41.09 v1(56.04,41.56)
  Top Layer w0.252: v1(58.78,36.27) 58.28,36.27 57.77,35.77 57.26,35.77 57.01,36.02 U3.5
  Bottom Layer w0.18: v1(47.15,41.82) 47.4,42.07 54,42.07 54.51,41.56 v1(56.04,41.56)
  Bottom Layer w0.252: v1(56.04,41.56) 57.81,41.56 60.56,38.81 60.56,38.05 v1(58.78,36.27)
SX_NSS: length 20.7
  Top Layer w0.18: v1(53.5,39.44) 53.75,39.69 U3.19 ; U2.32 36.48,38.33 39.02,40.87 47.91,40.87 v1(48.16,41.12)
  Bottom Layer w0.18: v1(48.16,41.12) 48.67,41.63 50.7,41.63 52.89,39.44 v1(53.5,39.44)
SX_RFI_N: length 7.5
  Top Layer w0.225: v1(53.5,38.11) 54.26,38.11 U3.22 ; L2.3 v1(51.56,33.03)
  Bottom Layer w0.225: v1(51.56,33.03) 51.56,34.55 53.75,36.75 53.75,37.86 v1(53.5,38.11)
SX_RFI_P: length 12.1
  Top Layer w0.225: L2.4 52.88,32.52 53.07,32.72 53.07,34.87 50.4,37.54 50.4,38.56 50.66,38.81 53.08,38.81 53.2,38.69 U3.21
SX_RFO: length 9.7
  Top Layer w0.225: v1(50.05,34.3) 49.8,34.05 49.8,32.78 50.05,32.52 L2.1 ; v1(52.84,37.09) 52.59,37.35 52.59,37.86 L4.2
  Top Layer w0.252: U3.23 53.95,37.69 53.61,37.35 53.1,37.35 52.59,37.86
  Bottom Layer w0.225: v1(50.05,34.3) v1(52.84,37.09)
SX_VR_PA: length 23
  Top Layer w0.252: 61.85,31.6 61.09,30.85 54.09,30.85 53.33,31.61 ; 53.08,36.18 53.59,35.67 53.59,32.62 53.33,32.37 v1(53.33,30.34) ; 53.08,36.18 52.82,36.18 51.16,37.84 L4.1 ; 53.08,36.18 54.09,37.2 U3.24 ; v1(53.33,28.56) 53.33,27.47 C9.2
  Bottom Layer w0.252: v1(53.33,30.34) v1(53.33,28.56)
USB_DM: length 18.2
  Top Layer w0.254: USB1.A7 12.31,47.06 12.08,47.3 11.57,47.3 11.31,47.04 USB1.B7 11.31,45.25 13.85,42.71 20.9,42.71 21.92,41.69 22.93,41.69 R5.2
USB_DP: length 14.9
  Top Layer w0.254: R4.2 23.12,43.71 14.61,43.71 12.83,45.49 ; USB1.B6 12.83,46.25 12.83,45.49 ; 12.83,45.49 12.58,45.24 12.07,45.24 11.81,45.49 USB1.A6
XIN: length 36.1
  Top Layer w0.18: X1.1 29.59,15.58 27.56,15.58 25.52,17.61 25.52,30.65 28.24,33.36 ; C11.1 26.65,33.36 28.49,33.36 29.25,34.12 30.27,34.12 32.05,35.9 U2.20
XOUT: length 27.1
  Top Layer w0.18: U2.21 32.45,35.65 27.88,31.08 C10.2
  Top Layer w0.254: 28.13,18.54 R2.2 30.78,18.29 X1.3 ; 28.13,18.54 28.13,19.59 27.88,19.84 C10.2 ; 28.13,18.54 26.93,18.54 R2.1
$1N27: length 8.9
  Top Layer w0.252: v1(59.18,37.69) 58.67,38.2 U3.9 ; v1(58.67,35.4) 58.67,34.13 59.53,33.27 60.77,33.27 L1.2
  Bottom Layer w0.252: v1(59.18,37.69) 58.16,36.67 58.16,35.91 v1(58.67,35.4)
$1N28: length 4.6
  Top Layer w0.252: U3.7 58.42,36.94 59.53,36.94 C3.1
  Top Layer w0.254: C3.1 60.1,34.07 L1.1
$1N54: length 39.7
  Top Layer w0.254: R1.2 50.43,41.28 v1(50.43,40.98) ; U1.4 48.91,37.93 v1(49.93,38.95) ; C4.2 36.72,12.11 36.72,17.1 40.27,20.66 v1(40.27,29.3)
  Bottom Layer w0.254: v1(40.27,29.3) v1(49.93,38.95) 49.93,40.47 v1(50.43,40.98)
$1N58: length 4.8
  Top Layer w0.225: L2.8 51.06,34.22 50.3,34.98 47.85,34.98 47.76,35.08 47.76,35.59 47.61,35.74
$1N59: length 4.1
  Top Layer w0.225: L2.6 52.06,34.03 50.35,35.74 U1.3
$1N61: length 28.2
  Top Layer w0.254: v1(37.59,17.1) 37.59,15.81 C5.2 ; U1.5 48.26,37.93 48.01,38.19 47.24,38.19 v1(43.69,34.63)
  Bottom Layer w0.254: v1(43.69,34.63) 37.59,28.53 v1(37.59,17.1)
$1N69: length 6.3
  Top Layer w0.254: 37.47,14.29 38.99,14.29 L3.1 40.19,10.54 C6.1
$1N70: length 3.8
  Top Layer w0.254: L3.2 40.46,14.22 C7.1
$1N85: length 14
  Top Layer w0.18: R4.1 23.15,42.18 24.5,42.18 25.01,42.69 v1(25.01,43.05) ; v1(33.14,44.32) 33.65,43.81 U2.47
  Bottom Layer w0.18: v1(33.14,44.32) 32.63,44.83 26.79,44.83 v1(25.01,43.05)
$1N86: length 15.8
  Top Layer w0.18: v1(25.41,40.77) 24.65,40 23.11,40 R5.1 ; v1(26.68,41.78) 30.24,45.34 33.03,45.34 33.79,44.58 33.79,44.07 34.05,43.81 U2.46
  Bottom Layer w0.18: v1(26.68,41.78) 26.43,41.78 v1(25.41,40.77)
$1N98: length 10.1
  Top Layer w0.254: C23.2 27.34,12.1 U4.1 26.96,12.89 26.45,13.4 26.45,14.16 26.96,14.67 27.21,14.67 U4.3
$1N100: length 6.1
  Top Layer w0.254: U4.5 24.74,11.02 C24.2
$1N103: length 7.6
  Top Layer w0.254: L5.2 16.39,37.18 USB1.4
$1N111: length 11.7
  Top Layer w0.254: USB1.A5 10.81,36.59 R6.1
$1N112: length 26.3
  Top Layer w0.254: R7.2 9.72,32.08 8.5,32.08 6.72,33.85 6.72,46.55 7.97,47.81 13.05,47.81 13.81,47.04 USB1.B5
